# Altium schematic sheet Compute-Module-Sheet-1.SchDoc
size 420 x 297 mm; SheetNumber: 2; SheetTotal: 3
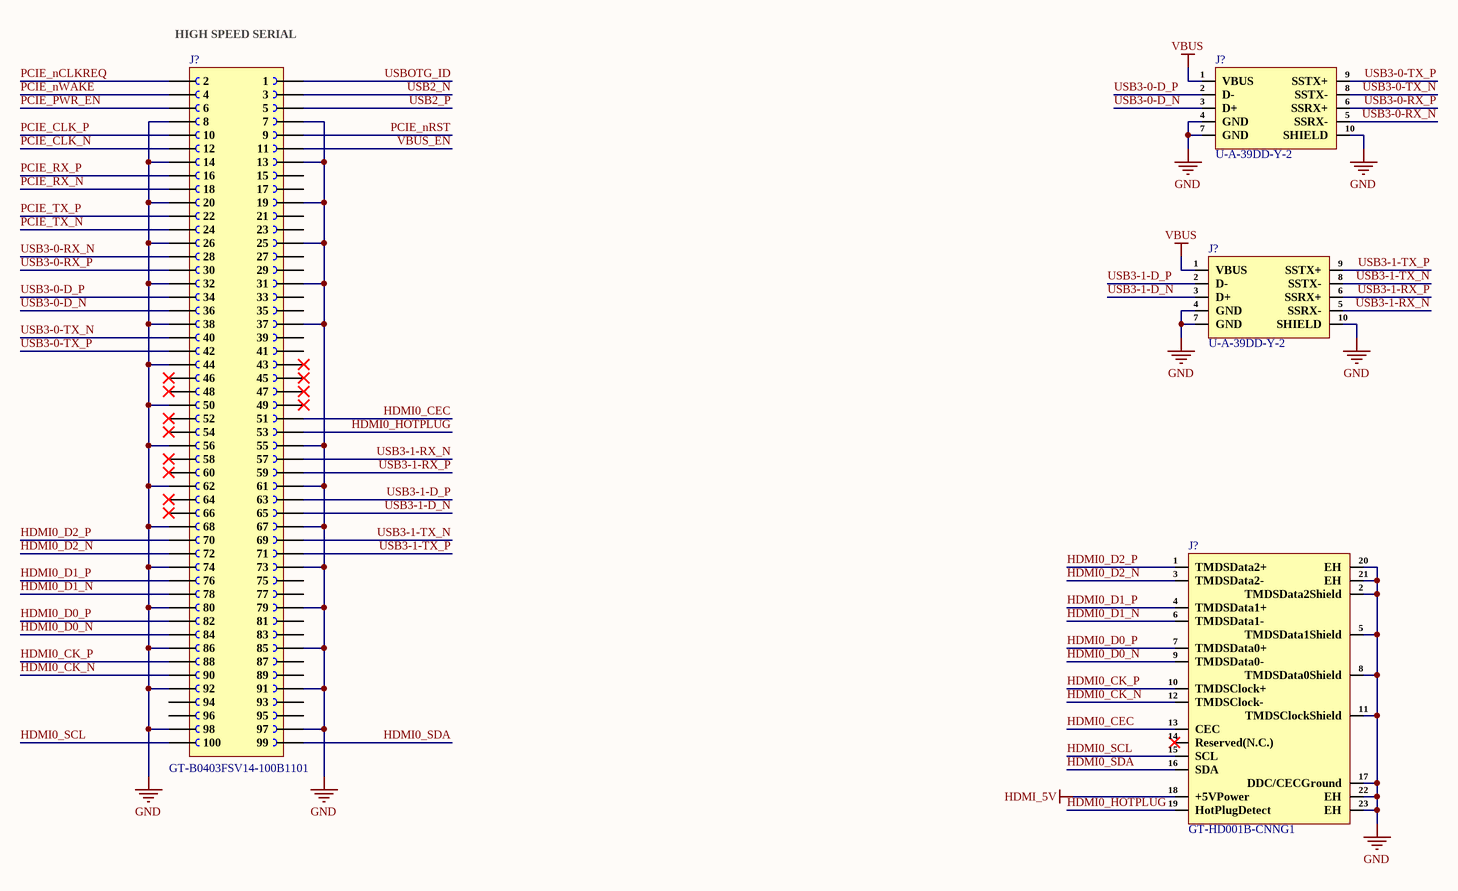
[diagram p0: Compute-Module-Sheet-1.SchDoc]

## Parts
(Parts that share a designator on the sheet are numbered #1, #2 ... from top to bottom, then left to right.)
J?#1  GT-B0403FSV14-100B1101  [GT-B0403FSV14-100B1101]
J?#2  U-A-39DD-Y-2  [U-A-39DD-Y-2]
J?#3  U-A-39DD-Y-2  [U-A-39DD-Y-2]
J?#4  GT-HD001B-CNNG1  [GT-HD001B-CNNG1]

## Nets
GND: J?#1.7 J?#1.8 J?#1.13 J?#1.14 J?#1.19 J?#1.20 J?#1.25 J?#1.26 J?#1.31 J?#1.32 J?#1.37 J?#1.38 J?#1.44 J?#1.50 J?#1.55 J?#1.56 J?#1.61 J?#1.62 J?#1.67 J?#1.68 J?#1.73 J?#1.74 J?#1.79 J?#1.80 J?#1.85 J?#1.86 J?#1.91 J?#1.92 J?#1.97 J?#1.98 J?#2.4(GND) J?#2.7(GND) J?#2.10(SHIELD) J?#3.4(GND) J?#3.7(GND) J?#3.10(SHIELD) J?#4.2(TMDSData2Shield) J?#4.5(TMDSData1Shield) J?#4.8(TMDSData0Shield) J?#4.11(TMDSClockShield) J?#4.17(DDC/CECGround) J?#4.20(EH) J?#4.21(EH) J?#4.22(EH) J?#4.23(EH)
HDMI_5V: J?#4.18(+5VPower)
VBUS: J?#2.1(VBUS) J?#3.1(VBUS)
HDMI0_CEC: J?#1.51 J?#4.13(CEC)
HDMI0_CK_N: J?#1.90 J?#4.12(TMDSClock-)
HDMI0_CK_P: J?#1.88 J?#4.10(TMDSClock+)
HDMI0_D0_N: J?#1.84 J?#4.9(TMDSData0-)
HDMI0_D0_P: J?#1.82 J?#4.7(TMDSData0+)
HDMI0_D1_N: J?#1.78 J?#4.6(TMDSData1-)
HDMI0_D1_P: J?#1.76 J?#4.4(TMDSData1+)
HDMI0_D2_N: J?#1.72 J?#4.3(TMDSData2-)
HDMI0_D2_P: J?#1.70 J?#4.1(TMDSData2+)
HDMI0_HOTPLUG: J?#1.53 J?#4.19(HotPlugDetect)
HDMI0_SCL: J?#1.100 J?#4.15(SCL)
HDMI0_SDA: J?#1.99 J?#4.16(SDA)
PCIE_CLK_N: J?#1.12
PCIE_CLK_P: J?#1.10
PCIE_nCLKREQ: J?#1.2
PCIE_nRST: J?#1.9
PCIE_nWAKE: J?#1.4
PCIE_PWR_EN: J?#1.6
PCIE_RX_N: J?#1.18
PCIE_RX_P: J?#1.16
PCIE_TX_N: J?#1.24
PCIE_TX_P: J?#1.22
USB2_N: J?#1.3
USB2_P: J?#1.5
USB3-0-D_N: J?#1.36 J?#2.3(D+)
USB3-0-D_P: J?#1.34 J?#2.2(D-)
USB3-0-RX_N: J?#1.28 J?#2.5(SSRX-)
USB3-0-RX_P: J?#1.30 J?#2.6(SSRX+)
USB3-0-TX_N: J?#1.40 J?#2.8(SSTX-)
USB3-0-TX_P: J?#1.42 J?#2.9(SSTX+)
USB3-1-D_N: J?#1.65 J?#3.3(D+)
USB3-1-D_P: J?#1.63 J?#3.2(D-)
USB3-1-RX_N: J?#1.57 J?#3.5(SSRX-)
USB3-1-RX_P: J?#1.59 J?#3.6(SSRX+)
USB3-1-TX_N: J?#1.69 J?#3.8(SSTX-)
USB3-1-TX_P: J?#1.71 J?#3.9(SSTX+)
USBOTG_ID: J?#1.1
VBUS_EN: J?#1.11

Not connected (* = marked no-connect by the designer): J?#1 15 17 21 23 27 29 33 35 39 41 43* 45* 46* 47* 48* 49* 52* 54* 58* 60* 64* 66* 75 77 81 83 87 89 93 94 95 96; J?#4 14(Reserved(N.C.))*

## Notes on the sheet
- (near J?#1) HIGH SPEED SERIAL
- File:
- Title:
- Date:
- Page
- Num:
- Total:
- Drawn By: Huzaifa Ali

## Library data of the parts
J?#1 = GT-B0403FSV14-100B1101: 0.4mm 2 100P -55℃~+125℃ Standing paste 0.3A SMD,P=0.4mm Board-to-Board and Backplane Connector ROHS; Manufacturer: G-Switch; Manufacturer Part Number: GT-B0403FSV14-100B1101; Package: SMD,P=0.4mm; LCSC Part Number: C42376244; Item Type: Connector; ComponentLink1Description: LCSC; ComponentLink1URL: https://www.lcsc.com/product-detail/Board-to-Board-and-Backplane-Connector_G-Switch-GT-B0403FSV14-100B1101_C42376244.html
J?#2 J?#3 = U-A-39DD-Y-2: USB 3.0 1.8A 1 Bend-in 9P Female Type-A Plugin USB Connectors ROHS; Manufacturer: Korean Hroparts Elec; Manufacturer Part Number: U-A-39DD-Y-2; Package: Plugin; LCSC Part Number: C707319; Item Type: USB Connector; ComponentLink1Description: LCSC; ComponentLink1URL: https://www.lcsc.com/product-detail/USB-Connectors_Korean-Hroparts-Elec-U-A-39DD-Y-2_C707319.html
J?#4 = GT-HD001B-CNNG1: SMD HDMI Connectors ROHS; Manufacturer: G-Switch; Manufacturer Part Number: GT-HD001B-CNNG1; Package: SMD; LCSC Part Number: C27636747; Item Type: HDMI Connector; ComponentLink1Description: LCSC; ComponentLink1URL: https://www.lcsc.com/product-detail/HDMI-Connectors_G-Switch-GT-HD001B-CNNG1_C27636747.html